# Altium project ADC_System_PCB.PrjPcb (part 1 of 3)
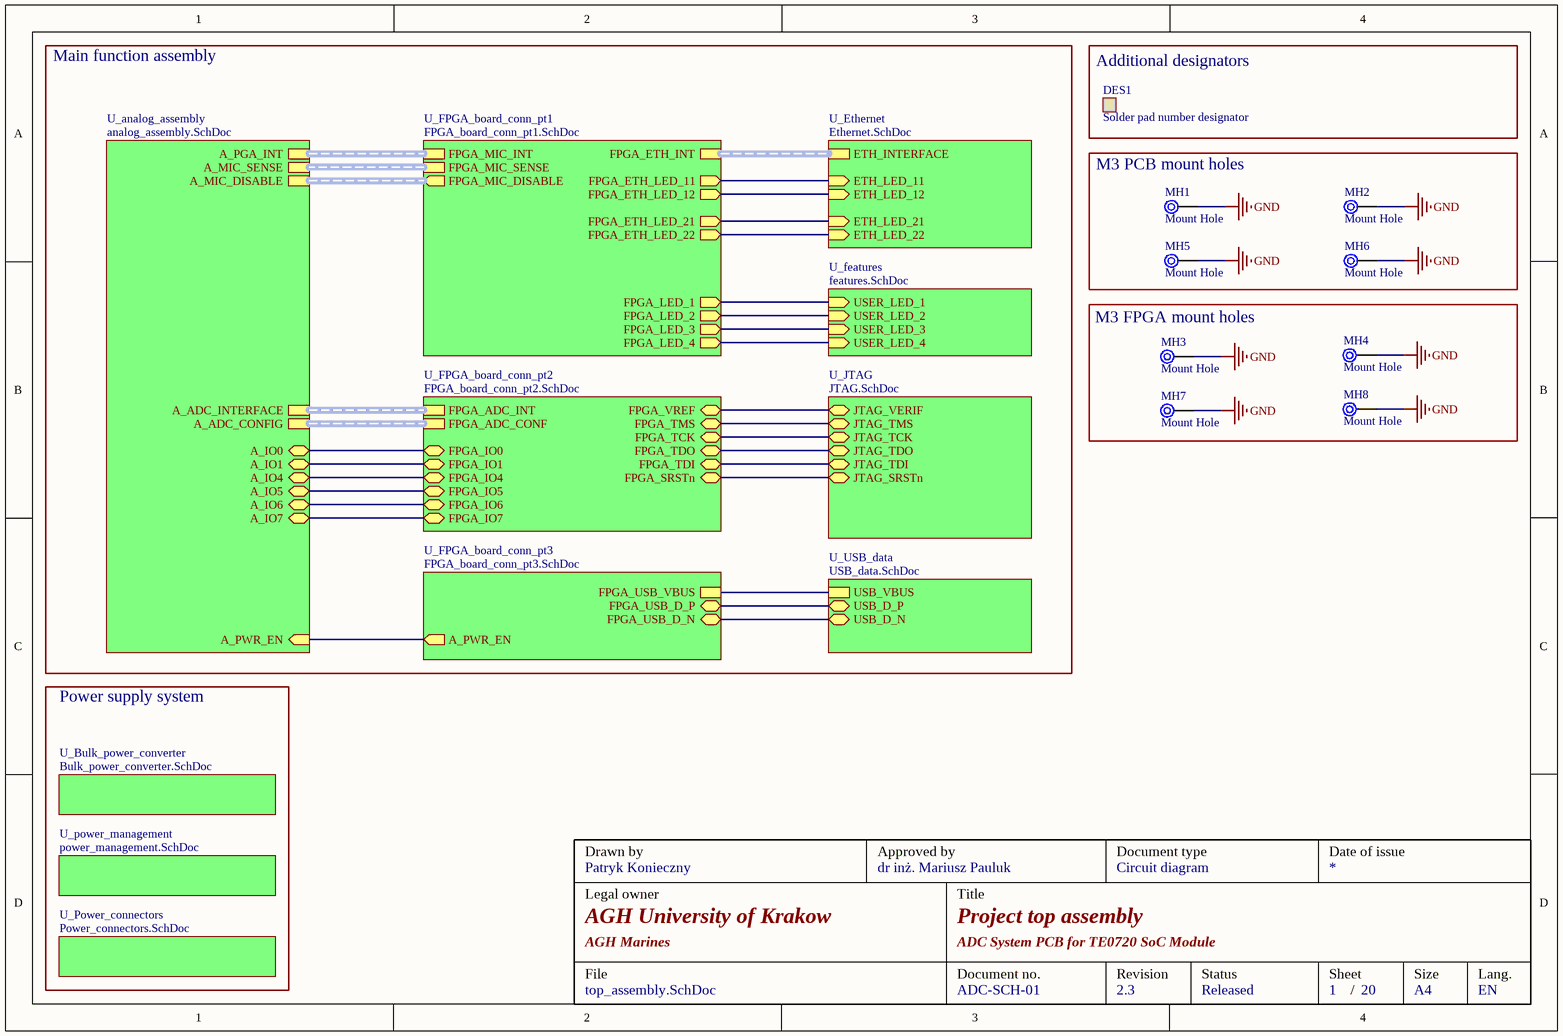
[diagram p0: top_assembly.SchDoc]
ProjectTitle: ADC System PCB for TE0720 SoC Module; ProjectRevision: 2.3; ProjectDrawnBy: Patryk Konieczny; ProjCompany: AGH University of Krakow; ProjApprovedBy: dr inż. Mariusz Pauluk; DocumentStatus: Released
20 sheets, 535 parts. Net scope: hierarchical (ports join the sheet entries above them; power ports are global).
Board file: main_ADC_PCB.PcbDoc
Sheets:
  top_assembly.SchDoc
    U_JTAG = JTAG.SchDoc
    U_USB_data = USB_data.SchDoc
    U_power_management = power_management.SchDoc
    U_Power_connectors = Power_connectors.SchDoc
    U_features = features.SchDoc
    U_Ethernet = Ethernet.SchDoc
    U_analog_assembly = analog_assembly.SchDoc
      U_signal_processing_assembly = signal_processing_assembly.SchDoc
        U_MIC_connection = MIC_connection.SchDoc
        U_MIC_connection = MIC_connection.SchDoc
        U_MIC_connection = MIC_connection.SchDoc
        U_MIC_connection = MIC_connection.SchDoc
        U_double_preamp = double_preamp.SchDoc
        U_double_preamp = double_preamp.SchDoc
        U_double_single_to_diff_conv = double_single_to_diff_conv.SchDoc
        U_double_single_to_diff_conv = double_single_to_diff_conv.SchDoc
        U_band_pass_diff_filter = band_pass_diff_filter.SchDoc
        U_band_pass_diff_filter = band_pass_diff_filter.SchDoc
        U_band_pass_diff_filter = band_pass_diff_filter.SchDoc
        U_band_pass_diff_filter = band_pass_diff_filter.SchDoc
      U_ADC = ADC.SchDoc
      U_switch_isolation = switch_isolation.SchDoc
      U_analog_power = analog_power.SchDoc
    U_Bulk_power_converter = Bulk_power_converter.SchDoc
    U_FPGA_board_conn_pt1 = FPGA_board_conn_pt1.SchDoc
    U_FPGA_board_conn_pt2 = FPGA_board_conn_pt2.SchDoc
    U_FPGA_board_conn_pt3 = FPGA_board_conn_pt3.SchDoc

## Sheet top_assembly.SchDoc: Project top assembly
size A4; ApprovedBy: dr inż. Mariusz Pauluk; CompanyName: AGH University of Krakow; DrawnBy: Patryk Konieczny; DocumentNumber: ADC-SCH-01; Revision: 2.3; SheetNumber: 1; SheetTotal: 20; DocumentStatus: Released

### Parts
DES1  Solder pad number designator  [DES_NUMBER]
MH1  Mount Hole  [MT_M3]
MH2  Mount Hole  [MT_M3]
MH3  Mount Hole  [MT_M3]
MH4  Mount Hole  [MT_M3]
MH5  Mount Hole  [MT_M3]
MH6  Mount Hole  [MT_M3]
MH7  Mount Hole  [MT_M3]
MH8  Mount Hole  [MT_M3]

### Blocks framed on the sheet
Additional designators: DES1
M3 PCB mount holes: MH1 MH2 MH5 MH6
M3 FPGA mount holes: MH3 MH4 MH7 MH8

### Sub-sheets
U_analog_assembly = analog_assembly.SchDoc: A_PWR_EN (in), A_MIC_SENSE (harness mic connected sense), A_MIC_DISABLE (harness mic analog disable), A_PGA_INT (harness PGA  interface), A_ADC_INTERFACE (harness ADC interface), A_ADC_CONFIG (harness ADC config), A_IO0 (bidir), A_IO1 (bidir), A_IO4 (bidir), A_IO5 (bidir), A_IO6 (bidir), A_IO7 (bidir)
U_Bulk_power_converter = Bulk_power_converter.SchDoc: no entries
U_Ethernet = Ethernet.SchDoc: ETH_LED_11 (in), ETH_LED_12 (in), ETH_LED_21 (in), ETH_LED_22 (in), ETH_INTERFACE (harness *)
U_features = features.SchDoc: USER_LED_1 (in), USER_LED_2 (in), USER_LED_3 (in), USER_LED_4 (in)
U_FPGA_board_conn_pt1 = FPGA_board_conn_pt1.SchDoc: FPGA_ETH_INT (harness ETH interface), FPGA_ETH_LED_11 (out), FPGA_ETH_LED_12 (out), FPGA_ETH_LED_21 (out), FPGA_ETH_LED_22 (out), FPGA_LED_1 (out), FPGA_LED_2 (out), FPGA_LED_3 (out), FPGA_LED_4 (out), FPGA_MIC_SENSE (harness mic connected sense), FPGA_MIC_DISABLE (out, harness mic analog disable), FPGA_MIC_INT (harness PGA  interface)
U_FPGA_board_conn_pt2 = FPGA_board_conn_pt2.SchDoc: FPGA_TCK (bidir), FPGA_TDO (bidir), FPGA_TDI (bidir), FPGA_TMS (bidir), FPGA_VREF (bidir), FPGA_SRSTn (bidir), FPGA_ADC_INT (harness ADC interface), FPGA_ADC_CONF (harness ADC config), FPGA_IO0 (bidir), FPGA_IO1 (bidir), FPGA_IO4 (bidir), FPGA_IO5 (bidir), FPGA_IO6 (bidir), FPGA_IO7 (bidir)
U_FPGA_board_conn_pt3 = FPGA_board_conn_pt3.SchDoc: FPGA_USB_VBUS, FPGA_USB_D_P (bidir), FPGA_USB_D_N (bidir), A_PWR_EN (out)
U_JTAG = JTAG.SchDoc: JTAG_VERIF (bidir), JTAG_TMS (bidir), JTAG_TCK (bidir), JTAG_TDO (bidir), JTAG_TDI (bidir), JTAG_SRSTn (bidir)
U_Power_connectors = Power_connectors.SchDoc: no entries
U_power_management = power_management.SchDoc: no entries
U_USB_data = USB_data.SchDoc: USB_VBUS, USB_D_P (bidir), USB_D_N (bidir)

### Nets
GND: MH1.1 MH2.1 MH3.1 MH4.1 MH5.1 MH6.1 MH7.1 MH8.1
IO0_FPGA: sheet U_analog_assembly/A_IO0, sheet U_FPGA_board_conn_pt2/FPGA_IO0
IO1_FPGA: sheet U_analog_assembly/A_IO1, sheet U_FPGA_board_conn_pt2/FPGA_IO1
IO4_FPGA: sheet U_analog_assembly/A_IO4, sheet U_FPGA_board_conn_pt2/FPGA_IO4
IO5_FPGA: sheet U_analog_assembly/A_IO5, sheet U_FPGA_board_conn_pt2/FPGA_IO5
IO6_FPGA: sheet U_analog_assembly/A_IO6, sheet U_FPGA_board_conn_pt2/FPGA_IO6
IO7_FPGA: sheet U_analog_assembly/A_IO7, sheet U_FPGA_board_conn_pt2/FPGA_IO7
JTAG_TCK: sheet U_JTAG/JTAG_TCK, sheet U_FPGA_board_conn_pt2/FPGA_TCK
JTAG_TDI: sheet U_JTAG/JTAG_TDI, sheet U_FPGA_board_conn_pt2/FPGA_TDI
JTAG_TDO: sheet U_JTAG/JTAG_TDO, sheet U_FPGA_board_conn_pt2/FPGA_TDO
JTAG_TMS: sheet U_JTAG/JTAG_TMS, sheet U_FPGA_board_conn_pt2/FPGA_TMS
JTAG_VREF: sheet U_JTAG/JTAG_VERIF, sheet U_FPGA_board_conn_pt2/FPGA_VREF
USB_D_N: sheet U_USB_data/USB_D_N, sheet U_FPGA_board_conn_pt3/FPGA_USB_D_N
USB_D_P: sheet U_USB_data/USB_D_P, sheet U_FPGA_board_conn_pt3/FPGA_USB_D_P
USB_VBUS: sheet U_USB_data/USB_VBUS, sheet U_FPGA_board_conn_pt3/FPGA_USB_VBUS
NetJM1_35: sheet U_features/USER_LED_1, sheet U_FPGA_board_conn_pt1/FPGA_LED_1
NetJM1_37: sheet U_features/USER_LED_2, sheet U_FPGA_board_conn_pt1/FPGA_LED_2
NetJM1_39: sheet U_features/USER_LED_3, sheet U_FPGA_board_conn_pt1/FPGA_LED_3
NetJM1_41: sheet U_features/USER_LED_4, sheet U_FPGA_board_conn_pt1/FPGA_LED_4
NetJM1_56: sheet U_Ethernet/ETH_LED_11, sheet U_FPGA_board_conn_pt1/FPGA_ETH_LED_11
NetJM1_58: sheet U_Ethernet/ETH_LED_12, sheet U_FPGA_board_conn_pt1/FPGA_ETH_LED_12
NetJM1_60: sheet U_Ethernet/ETH_LED_21, sheet U_FPGA_board_conn_pt1/FPGA_ETH_LED_21
NetJM1_62: sheet U_Ethernet/ETH_LED_22, sheet U_FPGA_board_conn_pt1/FPGA_ETH_LED_22
NetJM2_17: sheet U_JTAG/JTAG_SRSTn, sheet U_FPGA_board_conn_pt2/FPGA_SRSTn
NetJM3_26: sheet U_analog_assembly/A_PWR_EN, sheet U_FPGA_board_conn_pt3/A_PWR_EN

### Buses and harness runs
harness sheet U_analog_assembly/A_ADC_CONFIG = sheet U_FPGA_board_conn_pt2/FPGA_ADC_CONF
harness sheet U_analog_assembly/A_ADC_INTERFACE = sheet U_FPGA_board_conn_pt2/FPGA_ADC_INT
harness sheet U_analog_assembly/A_MIC_DISABLE = sheet U_FPGA_board_conn_pt1/FPGA_MIC_DISABLE
harness sheet U_analog_assembly/A_MIC_SENSE = sheet U_FPGA_board_conn_pt1/FPGA_MIC_SENSE
harness sheet U_analog_assembly/A_PGA_INT = sheet U_FPGA_board_conn_pt1/FPGA_MIC_INT
harness sheet U_Ethernet/ETH_INTERFACE = sheet U_FPGA_board_conn_pt1/FPGA_ETH_INT

### Notes on the sheet
- Main function assembly
- Power supply system
- Drawn by
- Approved by
- Document type
- Date of issue
- Legal owner
- Title
- Circuit diagram
- File
- AGH Marines
- Document no.
- Revision
- Status
- Sheet
- Size
- Lang.
- /
- A4
- EN

### Library data of the parts
MH1-MH8 = MH

## Sheet JTAG.SchDoc: TE0720 JTAG connector and reset
size A4; DocumentNumber: ADC-SCH-17; SheetNumber: 17; SheetTotal: 20
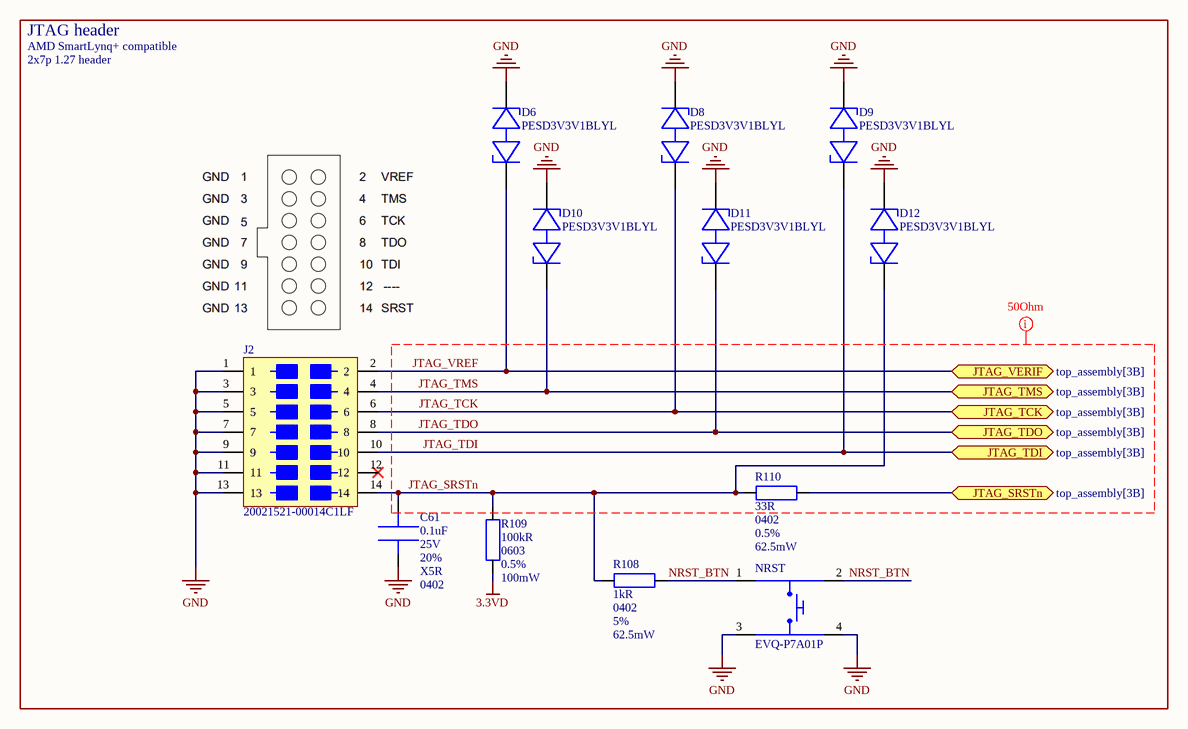
[diagram p1: JTAG.SchDoc]

### Parts
C61  value 0.1uF  Voltage: 25V  Tolerance: 20%  Dielectric: X5R  Package: 0402  [CAPC_0402]  (hidden comment: MSAST105SB5104MFNA01)
D6  PESD3V3V1BLYL  [DIOC_DFN-1006-2]
D8  PESD3V3V1BLYL  [DIOC_DFN-1006-2]
D9  PESD3V3V1BLYL  [DIOC_DFN-1006-2]
D10  PESD3V3V1BLYL  [DIOC_DFN-1006-2]
D11  PESD3V3V1BLYL  [DIOC_DFN-1006-2]
D12  PESD3V3V1BLYL  [DIOC_DFN-1006-2]
J2  20021521-00014C1LF  [CONS_20021521-00014C1LF]
NRST  EVQ-P7A01P  [SWS_EVQP7A]
R108  value 1kR  Package: 0402  Tolerance: 5%  Power: 62.5mW  [RESC_0402]  (hidden comment: RC0402JR-7D1KL)
R109  value 100kR  Package: 0603  Tolerance: 0.5%  Power: 100mW  [RESC_0603]  (hidden comment: AC0603DR-07100KL)
R110  value 33R  Package: 0402  Tolerance: 0.5%  Power: 62.5mW  [RESC_0402]  (hidden comment: RG1005R-330-D-T10)

### Ports
JTAG_SRSTn (bidir, see top_assembly[3B]), JTAG_TCK (bidir, see top_assembly[3B]), JTAG_TDI (bidir, see top_assembly[3B]), JTAG_TDO (bidir, see top_assembly[3B]), JTAG_TMS (bidir, see top_assembly[3B]), JTAG_VERIF (bidir, see top_assembly[3B])

### Nets
3.3VD: R109.2
GND: C61.2 D6.2 D8.2 D9.2 D10.2 D11.2 D12.2 J2.1 J2.3 J2.5 J2.7 J2.9 J2.11 J2.13 NRST.3 NRST.4
JTAG_SRSTn: C61.1 D12.1 J2.14 R108.1 R109.1 R110.2
JTAG_TCK: D8.1 J2.6 ; port JTAG_TCK
JTAG_TDI: D9.1 J2.10 ; port JTAG_TDI
JTAG_TDO: D11.1 J2.8 ; port JTAG_TDO
JTAG_TMS: D10.1 J2.4 ; port JTAG_TMS
JTAG_VREF: D6.1 J2.2 ; port JTAG_VERIF
NRST_BTN: NRST.1 NRST.2 R108.2
NetJM2_17: R110.1 ; port JTAG_SRSTn

Not connected (* = marked no-connect by the designer): J2 12*

### Layout directives
net class 50OhmSingle: JTAG_SRSTn, JTAG_TCK, JTAG_TDI, JTAG_TDO, JTAG_TMS, JTAG_VREF

### Notes on the sheet
- JTAG header
- AMD SmartLynq+ compatible
- 2x7p 1.27 header
- Drawn by
- Approved by
- Document type
- Date of issue
- Legal owner
- Title
- Circuit diagram
- File
- AGH Marines
- Document no.
- Revision
- Status
- Sheet
- Size
- Lang.
- /
- A4
- EN

### Library data of the parts
C61 = MSAST105SB5104MFNA01: Multilayer Ceramic Capacitors MLCC - SMD/SMT 25V 0.1uF X5R 0402 20%; Manufacturer: TAIYO YUDEN; Supplier 1: Mouser; Supplier Part Number 1: 963-MSAST105SB5104MF
D6 D8-D12 = PESD3V3V1BLYL: ESD Protection Diodes / TVS Diodes SOD882 3.3V BID ESD PROTECT; Manufacturer: Nexperia; Capacitance: 11pF; Package: DFN-1006-2; Voltage: 3.3V; Supplier 1: Mouser; Supplier Part Number 1: 771-PESD3V3V1BLYL
J2 = 20021521-00014C1LF: Headers & Wire Housings VERTICAL SMT TYPE HEADER; Manufacturer: Amphenol FCI; Supplier 1: Mouser; Supplier Part Number 1: 649-202152100014C1LF
NRST = EVQ-P7A01P: Tactile Switches 3.5x2.9mm Right Ang Light Touch Switch; Manufacturer: Panasonic; Supplier 1: Mouser; Supplier Part Number 1: 667-EVQP7A01P
R108 = RC0402JR-7D1KL: Thick Film Resistors - SMD General Purpose Chip Resistor 0402, 1kOhms, 5%, 1/16W; Manufacturer: YAGEO; Supplier 1: Mouser; Supplier Part Number 1: 603-RC0402JR-7D1KL
R109 = AC0603DR-07100KL: Thick Film Resistors - SMD 100 kOhms 1/10 W 75 V 0.5 % 0603 100 PPM / C - 55 C / + 155 C AEC-Q200; Manufacturer: YAGEO; Supplier 1: Mouser; Supplier Part Number 1: 603-AC0603DR-07100KL
R110 = RG1005R-330-D-T10: Thin Film Resistors - SMD 1/16W 33 Ohms 0.5% 0402 100ppm; Manufacturer: Susumu; Supplier 1: Mouser; Supplier Part Number 1: 754-RG1005R-330DT10

## Sheet USB_data.SchDoc: USB-C 2.0 connector
size A4; DocumentNumber: ADC-SCH-20; SheetNumber: 20; SheetTotal: 20
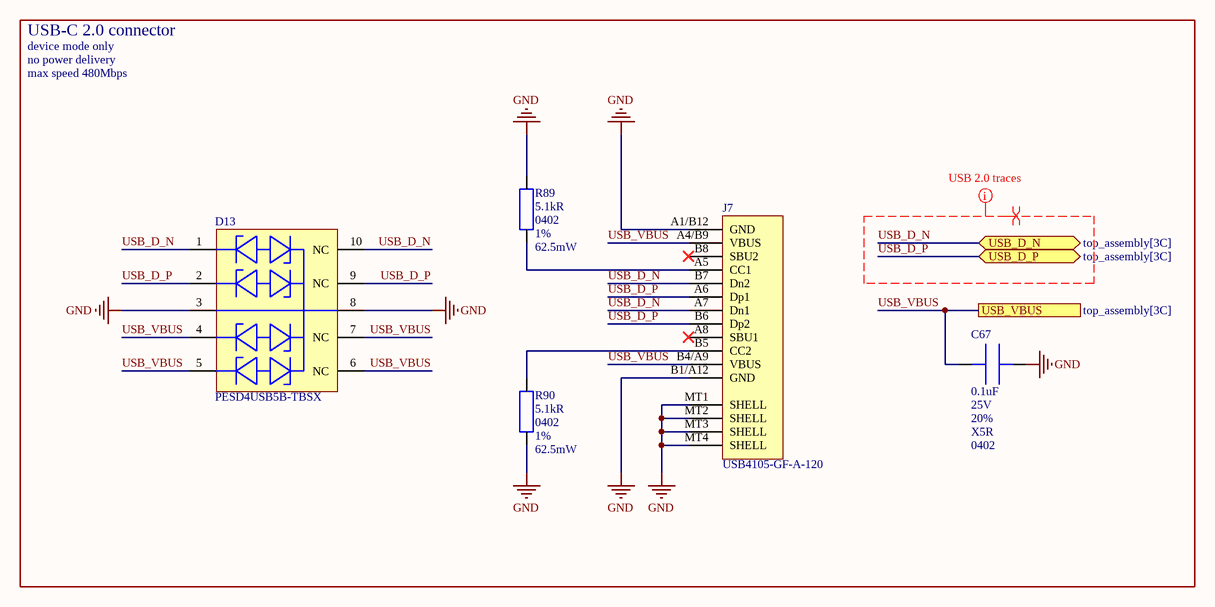
[diagram p2: USB_data.SchDoc]

### Parts
C67  value 0.1uF  Voltage: 25V  Tolerance: 20%  Dielectric: X5R  Package: 0402  [CAPC_0402]  (hidden comment: MSAST105SB5104MFNA01)
D13  PESD4USB5B-TBSX  [DIOC_DFN-2510A-10]
J7  USB4105-GF-A-120  [CONT_USB4105-GF-A-120]
R89  value 5.1kR  Package: 0402  Tolerance: 1%  Power: 62.5mW  [RESC_0402]  (hidden comment: AC0402FR-075K1L)
R90  value 5.1kR  Package: 0402  Tolerance: 1%  Power: 62.5mW  [RESC_0402]  (hidden comment: AC0402FR-075K1L)

### Ports
USB_D_N (bidir, see top_assembly[3C]), USB_D_P (bidir, see top_assembly[3C]), USB_VBUS (see top_assembly[3C])

### Nets
GND: C67.1 D13.3 D13.8 J7.A1/B12(GND) J7.B1/A12(GND) J7.MT1(SHELL) J7.MT2(SHELL) J7.MT3(SHELL) J7.MT4(SHELL) R89.2 R90.2
USB_D_N: D13.1 D13.10(NC) J7.A7(Dn1) J7.B7(Dn2) ; port USB_D_N
USB_D_P: D13.2 D13.9(NC) J7.A6(Dp1) J7.B6(Dp2) ; port USB_D_P
USB_VBUS: C67.2 D13.4 D13.5 D13.6(NC) D13.7(NC) J7.A4/B9(VBUS) J7.B4/A9(VBUS) ; port USB_VBUS
NetJ7_A5: J7.A5(CC1) R89.1
NetJ7_B5: J7.B5(CC2) R90.1

Not connected (* = marked no-connect by the designer): J7 A8(SBU1)* B8(SBU2)*

### Layout directives
mark named USB 2.0 traces: USB_D_N, USB_D_P
differential pair; differential pair class 90OhmDiff: USB_D_N, USB_D_P

### Notes on the sheet
- USB-C 2.0 connector
- device mode only
- no power delivery
- max speed 480Mbps
- Drawn by
- Approved by
- Document type
- Date of issue
- Legal owner
- Title
- Circuit diagram
- File
- AGH Marines
- Document no.
- Revision
- Status
- Sheet
- Size
- Lang.
- /
- A4
- EN

### Library data of the parts
C67 = MSAST105SB5104MFNA01: as C61 on sheet JTAG; Supplier 1: Mouser; Supplier Part Number 1: 963-MSAST105SB5104MF
D13 = PESD4USB5B-TBSX: ESD Protection Diodes / TVS Diodes ESD 5V BI; Manufacturer: Nexperia; Capacitance: 0.3pF; Package: DFN-2510D-10; Voltage: 5V; Supplier 1: Mouser; Supplier Part Number 1: 771-PESD4USB5B-TBSX
J7 = USB4105-GF-A-120: USB Connectors USB Type C, 2.0 SMT PCB Top Mnt 1.20mm; Manufacturer: GCT; Supplier 1: Mouser; Supplier Part Number 1: 640-USB4105-GF-A-120
R89 R90 = AC0402FR-075K1L: Thick Film Resistors - SMD 5.1 kOhms 1/16 W 50 V 1 % 0402 100 PPM / C - 55 C / + 155 C AEC-Q200; Manufacturer: YAGEO; Supplier 1: Mouser; Supplier Part Number 1: 603-AC0402FR-075K1L

## Sheet power_management.SchDoc: Low-noise powr supply for digital systems
size A4; DocumentNumber: ADC-SCH-19; SheetNumber: 19; SheetTotal: 20
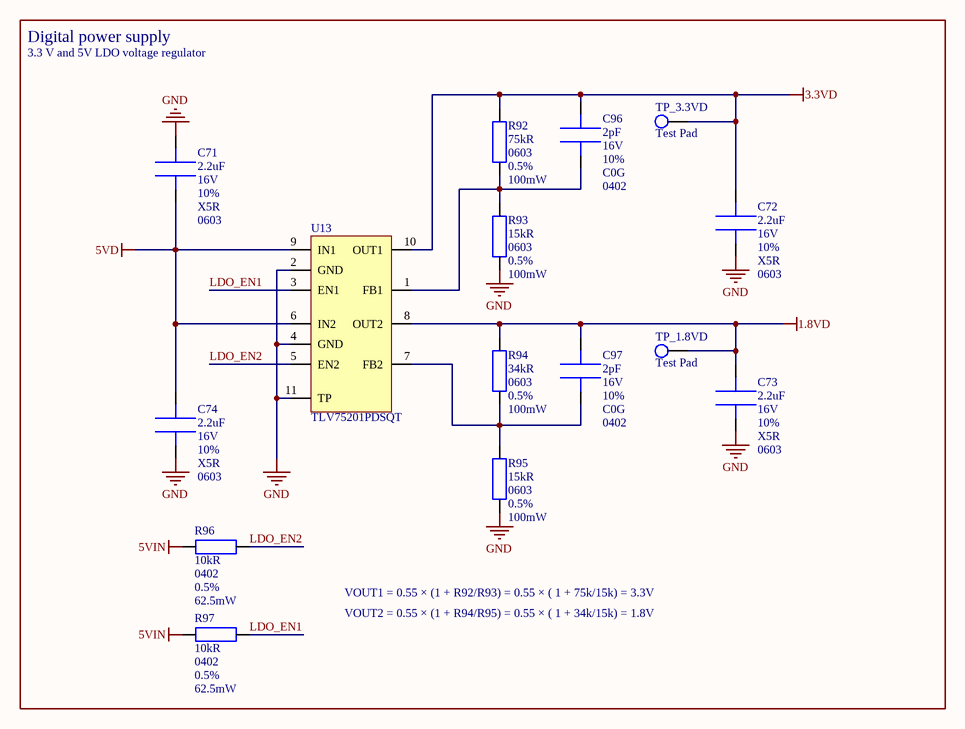
[diagram p3: power_management.SchDoc]

### Parts
C71  value 2.2uF  Voltage: 16V  Tolerance: 10%  Dielectric: X5R  Package: 0603  [CAPC_0603]  (hidden comment: C0603C225K4PAC)
C72  value 2.2uF  Voltage: 16V  Tolerance: 10%  Dielectric: X5R  Package: 0603  [CAPC_0603]  (hidden comment: C0603C225K4PAC)
C73  value 2.2uF  Voltage: 16V  Tolerance: 10%  Dielectric: X5R  Package: 0603  [CAPC_0603]  (hidden comment: C0603C225K4PAC)
C74  value 2.2uF  Voltage: 16V  Tolerance: 10%  Dielectric: X5R  Package: 0603  [CAPC_0603]  (hidden comment: C0603C225K4PAC)
C96  value 2pF  Voltage: 16V  Tolerance: 10%  Dielectric: C0G  Package: 0402  [CAPC_0402]  (hidden comment: GJM1555C1H2R0CB01J)
C97  value 2pF  Voltage: 16V  Tolerance: 10%  Dielectric: C0G  Package: 0402  [CAPC_0402]  (hidden comment: GJM1555C1H2R0CB01J)
R92  value 75kR  Package: 0603  Tolerance: 0.5%  Power: 100mW  [RESC_0603]  (hidden comment: RT0603DRD0775KL)
R93  value 15kR  Package: 0603  Tolerance: 0.5%  Power: 100mW  [RESC_0603]  (hidden comment: RT0603DRD0715KL)
R94  value 34kR  Package: 0603  Tolerance: 0.5%  Power: 100mW  [RESC_0603]  (hidden comment: RT0603DRE0734KL)
R95  value 15kR  Package: 0603  Tolerance: 0.5%  Power: 100mW  [RESC_0603]  (hidden comment: RT0603DRD0715KL)
R96  value 10kR  Package: 0402  Tolerance: 0.5%  Power: 62.5mW  [RESC_0402]  (hidden comment: AC0402DR-0710KL)
R97  value 10kR  Package: 0402  Tolerance: 0.5%  Power: 62.5mW  [RESC_0402]  (hidden comment: AC0402DR-0710KL)
TP_1.8VD  Test Pad  [TP_1.4mm]
TP_3.3VD  Test Pad  [TP_1.4mm]
U13  TLV75201PDSQT  [IC_WSON-10]

### Nets
1.8VD: C73.1 C97.1 R94.1 TP_1.8VD.1 U13.8(OUT2)
3.3VD: C72.1 C96.1 R92.2 TP_3.3VD.1 U13.10(OUT1)
5VD: C71.2 C74.1 U13.6(IN2) U13.9(IN1)
5VIN: R96.2 R97.2
GND: C71.1 C72.2 C73.2 C74.2 R93.1 R95.1 U13.2(GND) U13.4(GND) U13.11(TP)
LDO_EN1: R97.1 U13.3(EN1)
LDO_EN2: R96.1 U13.5(EN2)
NetC96_2: C96.2 R92.1 R93.2 U13.1(FB1)
NetC97_2: C97.2 R94.2 R95.2 U13.7(FB2)

### Notes on the sheet
- Digital power supply
- 3.3 V and 5V LDO voltage regulator
- VOUT1 = 0.55 × (1 + R92/R93) = 0.55 × ( 1 + 75k/15k) = 3.3V
- VOUT2 = 0.55 × (1 + R94/R95) = 0.55 × ( 1 + 34k/15k) = 1.8V
- Drawn by
- Approved by
- Document type
- Date of issue
- Legal owner
- Title
- Circuit diagram
- File
- AGH Marines
- Document no.
- Revision
- Status
- Sheet
- Size
- Lang.
- /
- A4
- EN

### Library data of the parts
C71-C74 = C0603C225K4PAC: Multilayer Ceramic Capacitors MLCC - SMD/SMT 16V 2.2uF X5R 0603 10%; Manufacturer: KEMET; Supplier 1: Mouser; Supplier Part Number 1: 80-C0603C225K4PAC
C96 C97 = GJM1555C1H2R0CB01J: Multilayer Ceramic Capacitors MLCC - SMD/SMT 2 pF 50 VDC 0.25 pF 0402 C0G (NP0); Manufacturer: Murata Electronics; Supplier 1: Mouser; Supplier Part Number 1: 81-GJM1555C1H2R0CB1J
R92 = RT0603DRD0775KL: Thin Film Resistors 1/10W 75K ohm .5% 25ppm; Manufacturer: YAGEO; Supplier 1: Mouser; Supplier Part Number 1: 603-RT0603DRD0775KL
R93 R95 = RT0603DRD0715KL: Thin Film Resistors 15K Ohm 0.5% 1/10W 75 Volts 25ppm; Manufacturer: YAGEO; Supplier 1: Mouser; Supplier Part Number 1: 603-RT0603DRD0715KL
R94 = RT0603DRE0734KL: Thin Film Resistors 1/10W 34K ohm .5% 50ppm; Manufacturer: YAGEO; Supplier 1: Mouser; Supplier Part Number 1: 603-RT0603DRE0734KL
R96 R97 = AC0402DR-0710KL: Thick Film Resistors - SMD 10 kOhms 1/16 W 50 V 1% 0402 100 PPM / C - 55 C + 155 C AEC-Q200; Manufacturer: YAGEO; Supplier 1: Mouser; Supplier Part Number 1: 603-AC0402DR-0710KL
U13 = TLV75201PDSQT: LDO Voltage Regulators 1-A low-IQ high-PS RR adjustable dual A 595-TLV75201PDSQR; Manufacturer: Texas Instruments; Package: WSON-10; Supplier 1: Mouser; Supplier Part Number 1: 595-TLV75201PDSQT

## Sheet Power_connectors.SchDoc: Power connectors and power LEDs
size A4; DocumentNumber: ADC-SCH-18; SheetNumber: 18; SheetTotal: 20
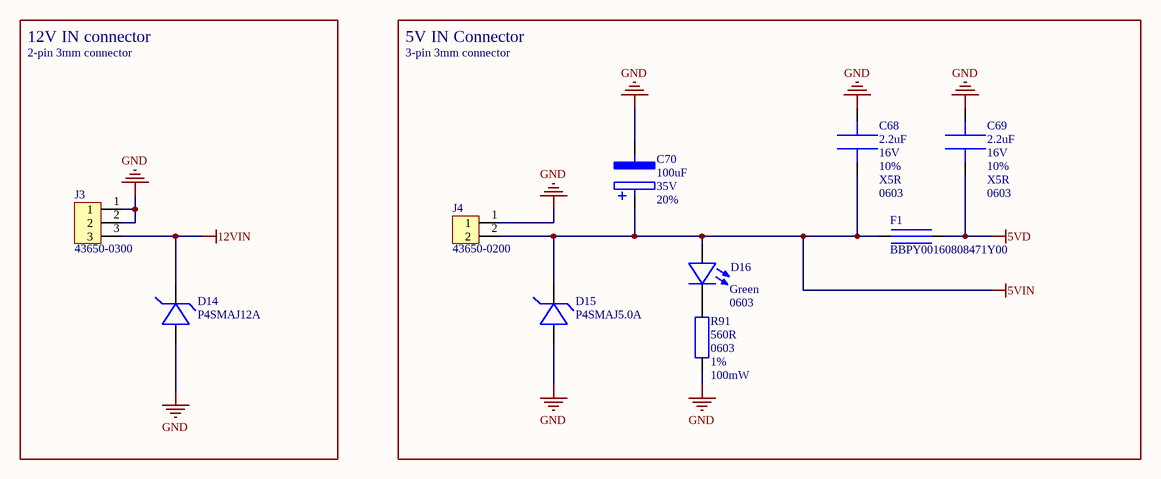
[diagram p4: Power_connectors.SchDoc]

### Parts
C68  value 2.2uF  Voltage: 16V  Tolerance: 10%  Dielectric: X5R  Package: 0603  [CAPC_0603]  (hidden comment: C0603C225K4PAC)
C69  value 2.2uF  Voltage: 16V  Tolerance: 10%  Dielectric: X5R  Package: 0603  [CAPC_0603]  (hidden comment: C0603C225K4PAC)
C70  value 100uF  Voltage: 35V  Tolerance: 20%  [CAPE_6.3R_7.7H]  (hidden comment: EDK107M035S9HAA)
D14  P4SMAJ12A  [DIOC_DO-214AC]
D15  P4SMAJ5.0A  [DIOC_DO-214AC]
D16  package: 0603  color: Green  [DIOC_0603_LED]  (hidden comment: KG EELP41.22-PHRH-35-A8J8-20-R18)
F1  BBPY00160808471Y00  [FERC_0603]
J3  43650-0300  [CONT_43650-0300]
J4  43650-0200  [CONT_43650-0200]
R91  value 560R  Package: 0603  Tolerance: 1%  Power: 100mW  [RESC_0603]  (hidden comment: RC0603FR-07560RL)

### Blocks framed on the sheet
12V IN connector: D14 J3
5V IN Connector: C68-C70 D15 D16 F1 J4 R91

### Nets
5VD: C69.2 F1.1
5VIN: C68.2 C70.1 D15.2 D16.1 F1.2 J4.2
12VIN: D14.2 J3.3
GND: C68.1 C69.1 C70.2 D14.1 D15.1 J3.1 J3.2 J4.1 R91.2
NetD16_2: D16.2 R91.1

### Notes on the sheet
- 2-pin 3mm connector
- 3-pin 3mm connector
- Drawn by
- Approved by
- Document type
- Date of issue
- Legal owner
- Title
- Circuit diagram
- File
- AGH Marines
- Document no.
- Revision
- Status
- Sheet
- Size
- Lang.
- /
- A4
- EN

### Library data of the parts
C68 C69 = C0603C225K4PAC: as C71 on sheet power_management; Supplier 1: Mouser; Supplier Part Number 1: 80-C0603C225K4PAC
C70 = EDK107M035S9HAA: Aluminum Electrolytic Capacitors - SMD 35V 100uF AEC-Q200 20% 85C/2K Hours; Manufacturer: KEMET; Package: 6.3x7.7; Supplier 1: Mouser; Supplier Part Number 1: 80-EDK107M035S9HAA
D14 = P4SMAJ12A: ESD Protection Diodes / TVS Diodes TVS, SMA, 150C, 400W, Unidir; Manufacturer: Diotec Semiconductor; Breakdown voltage: 12V; Package: DO-214AC-2; Supplier 1: Mouser; Supplier Part Number 1: 637-P4SMAJ12A
D15 = P4SMAJ5.0A: ESD Protection Diodes / TVS Diodes TVS, SMA, 150C, 400W, Unidir; Manufacturer: Diotec Semiconductor; Breakdown voltage: 5V; Package: DO-214AC-2; Supplier 1: Mouser; Supplier Part Number 1: 637-P4SMAJ5.0A
D16 = KG EELP41.22-PHRH-35-A8J8-20-R18: Single Color LEDs; Supplier 1: Mouser; Supplier Part Number 1: 720-P4122PHRH35A8J82
F1 = BBPY00160808471Y00: Ferrite Beads 470Ohms RDC=0.15Ohms 1500mA; Manufacturer: Pulse Electronics; Package: 0603; Supplier 1: Mouser; Supplier Part Number 1: 603-BBPY160808471Y00
J3 = 43650-0300: Headers & Wire Housings R/A HEADER 3 POS TIN SINGLE ROW; Manufacturer: Molex; Pin number: 3; Supplier 1: Mouser; Supplier Part Number 1: 538-43650-0300
J4 = 43650-0200: Nr Mouser: / 538-43650-0200 / Nr prod.: / 43650-0200 / Produc.: / Molex / Nr klienta: / Nr klienta / Opis: / Headers & Wire Housings R/A HEADER 2 POS TIN SINGLE ROW; Pin number: 2; Manufacturer: Molex; Supplier 1: Mouser; Supplier Part Number 1: 538-43650-0200
R91 = RC0603FR-07560RL: Thick Film Resistors - SMD General Purpose Chip Resistor 0603, 560Ohms, 1%, 1/10W; Manufacturer: YAGEO; Supplier 1: Mouser; Supplier Part Number 1: 603-RC0603FR-07560RL

## Sheet features.SchDoc: Features: User LEDs
size A4; DocumentNumber: ADC-SCH-13; SheetNumber: 13; SheetTotal: 20
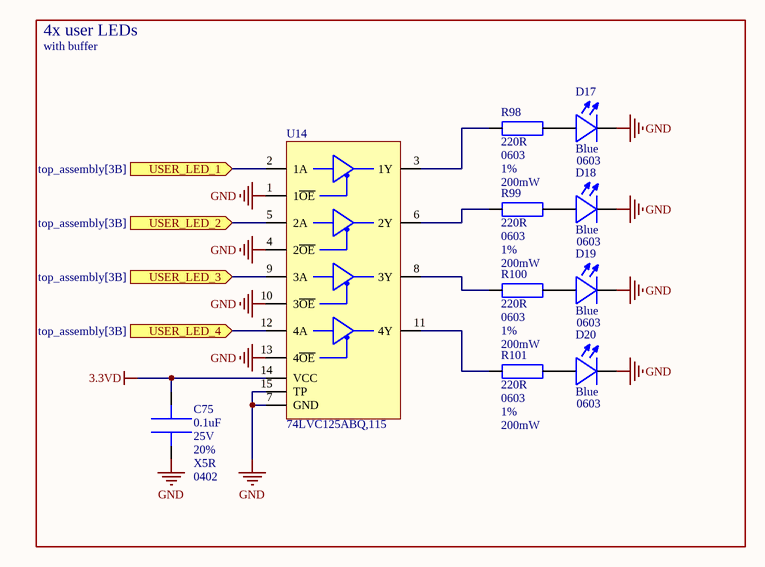
[diagram p5: features.SchDoc]

### Parts
C75  value 0.1uF  Voltage: 25V  Tolerance: 20%  Dielectric: X5R  Package: 0402  [CAPC_0402]  (hidden comment: MSAST105SB5104MFNA01)
D17  package: 0603  color: Blue  [DIOC_0603_LED]  (hidden comment: KB EELP41.12-P1R2-36-3X4X-5-R18)
D18  package: 0603  color: Blue  [DIOC_0603_LED]  (hidden comment: KB EELP41.12-P1R2-36-3X4X-5-R18)
D19  package: 0603  color: Blue  [DIOC_0603_LED]  (hidden comment: KB EELP41.12-P1R2-36-3X4X-5-R18)
D20  package: 0603  color: Blue  [DIOC_0603_LED]  (hidden comment: KB EELP41.12-P1R2-36-3X4X-5-R18)
R98  value 220R  Package: 0603  Tolerance: 1%  Power: 200mW  [RESC_0603]  (hidden comment: AC0603FR-7W220RL)
R99  value 220R  Package: 0603  Tolerance: 1%  Power: 200mW  [RESC_0603]  (hidden comment: AC0603FR-7W220RL)
R100  value 220R  Package: 0603  Tolerance: 1%  Power: 200mW  [RESC_0603]  (hidden comment: AC0603FR-7W220RL)
R101  value 220R  Package: 0603  Tolerance: 1%  Power: 200mW  [RESC_0603]  (hidden comment: AC0603FR-7W220RL)
U14  74LVC125ABQ,115  [IC_DHVQFN-14]

### Ports
USER_LED_1 (in, see top_assembly[3B]), USER_LED_2 (in, see top_assembly[3B]), USER_LED_3 (in, see top_assembly[3B]), USER_LED_4 (in, see top_assembly[3B])

### Nets
3.3VD: C75.1 U14.14(VCC)
GND: C75.2 D17.2 D18.2 D19.2 D20.2 U14.1(1~{OE}) U14.4(2~{OE}) U14.7(GND) U14.10(3~{OE}) U14.13(4~{OE}) U14.15(TP)
NetD17_1: D17.1 R98.1
NetD18_1: D18.1 R99.1
NetD19_1: D19.1 R100.1
NetD20_1: D20.1 R101.1
NetJM1_35: U14.2(1A) ; port USER_LED_1
NetJM1_37: U14.5(2A) ; port USER_LED_2
NetJM1_39: U14.9(3A) ; port USER_LED_3
NetJM1_41: U14.12(4A) ; port USER_LED_4
NetR98_2: R98.2 U14.3(1Y)
NetR99_2: R99.2 U14.6(2Y)
NetR100_2: R100.2 U14.8(3Y)
NetR101_2: R101.2 U14.11(4Y)

### Notes on the sheet
- 4x user LEDs
- with buffer
- Drawn by
- Approved by
- Document type
- Date of issue
- Legal owner
- Title
- Circuit diagram
- File
- AGH Marines
- Document no.
- Revision
- Status
- Sheet
- Size
- Lang.
- /
- A4
- EN

### Library data of the parts
C75 = MSAST105SB5104MFNA01: as C61 on sheet JTAG; Supplier 1: Mouser; Supplier Part Number 1: 963-MSAST105SB5104MF
D17-D20 = KB EELP41.12-P1R2-36-3X4X-5-R18: Single Color LEDs; Supplier 1: Mouser; Supplier Part Number 1: 720-P4112P1R2363X4X5
R98-R101 = AC0603FR-7W220RL: Thick Film Resistors - SMD 220 Ohms 1/5 W 75 V 1% 0603 100 PPM / C - 55 C / + 155 C AEC-Q200; Manufacturer: YAGEO; Supplier 1: Mouser; Supplier Part Number 1: 603-AC0603FR-7W220RL
U14 = 74LVC125ABQ,115: Buffers & Line Drivers SOT762-1 BUFFERS & LINE DVRS; Manufacturer: Nexperia; Package: DHVQFN-14; Supplier 1: Mouser; Supplier Part Number 1: 771-LVC125ABQ115

## Sheet Ethernet.SchDoc: Ethernet connector and status LEDs
size A4; DocumentNumber: ADC-SCH-12; SheetNumber: 12; SheetTotal: 20
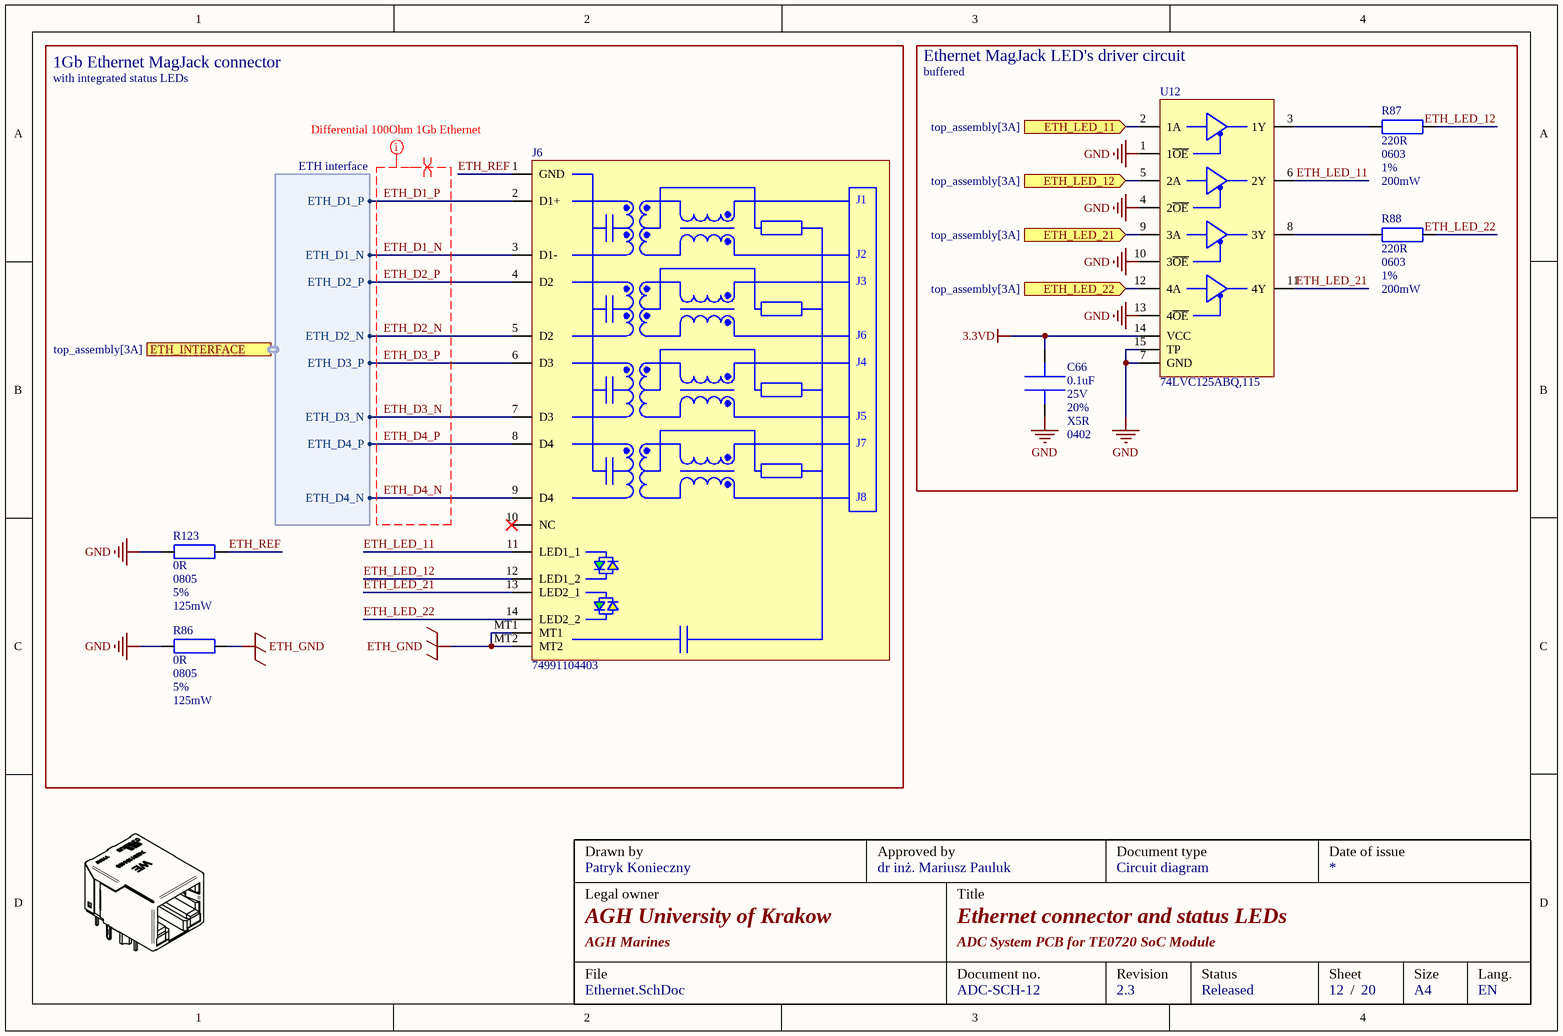
[diagram p6: Ethernet.SchDoc]

### Parts
C66  value 0.1uF  Voltage: 25V  Tolerance: 20%  Dielectric: X5R  Package: 0402  [CAPC_0402]  (hidden comment: MSAST105SB5104MFNA01)
J6  74991104403  [CONT_74991104403]
R86  value 0R  Package: 0805  Tolerance: 5%  Power: 125mW  [RESC_0805]  (hidden comment: RC0805JR-070RP)
R87  value 220R  Package: 0603  Tolerance: 1%  Power: 200mW  [RESC_0603]  (hidden comment: AC0603FR-7W220RL)
R88  value 220R  Package: 0603  Tolerance: 1%  Power: 200mW  [RESC_0603]  (hidden comment: AC0603FR-7W220RL)
R123  value 0R  Package: 0805  Tolerance: 5%  Power: 125mW  [RESC_0805]  (hidden comment: RC0805JR-070RP)
U12  74LVC125ABQ,115  [IC_DHVQFN-14]

### Blocks framed on the sheet
1Gb Ethernet MagJack connector: J6 R86 R123

### Ports
ETH_INTERFACE (harness ETH interface, see top_assembly[3A]), ETH_LED_11 (in, see top_assembly[3A]), ETH_LED_12 (in, see top_assembly[3A]), ETH_LED_21 (in, see top_assembly[3A]), ETH_LED_22 (in, see top_assembly[3A])

### Harnesses
ETH interface: ETH_D1_P, ETH_D1_N, ETH_D2_P, ETH_D2_N, ETH_D3_P, ETH_D3_N, ETH_D4_P, ETH_D4_N

### Nets
3.3VD: C66.1 U12.14(VCC)
ETH_GND: J6.MT1 J6.MT2 R86.1
GND: C66.2 R86.2 R123.2 U12.1(1~{OE}) U12.4(2~{OE}) U12.7(GND) U12.10(3~{OE}) U12.13(4~{OE}) U12.15(TP)
ETH_D1_N: J6.3(D1-) ; port ETH_INTERFACE.ETH_D1_N
ETH_D1_P: J6.2(D1+) ; port ETH_INTERFACE.ETH_D1_P
ETH_D2_N: J6.5(D2) ; port ETH_INTERFACE.ETH_D2_N
ETH_D2_P: J6.4(D2) ; port ETH_INTERFACE.ETH_D2_P
ETH_D3_N: J6.7(D3) ; port ETH_INTERFACE.ETH_D3_N
ETH_D3_P: J6.6(D3) ; port ETH_INTERFACE.ETH_D3_P
ETH_D4_N: J6.9(D4) ; port ETH_INTERFACE.ETH_D4_N
ETH_D4_P: J6.8(D4) ; port ETH_INTERFACE.ETH_D4_P
ETH_LED_11: J6.11(LED1_1) U12.6(2Y)
ETH_LED_12: J6.12(LED1_2) R87.1
ETH_LED_21: J6.13(LED2_1) U12.11(4Y)
ETH_LED_22: J6.14(LED2_2) R88.1
ETH_REF: J6.1(GND) R123.1
NetJM1_56: U12.2(1A) ; port ETH_LED_11
NetJM1_58: U12.5(2A) ; port ETH_LED_12
NetJM1_60: U12.9(3A) ; port ETH_LED_21
NetJM1_62: U12.12(4A) ; port ETH_LED_22
NetR87_2: R87.2 U12.3(1Y)
NetR88_2: R88.2 U12.8(3Y)

Not connected (* = marked no-connect by the designer): J6 10(NC)*

### Layout directives
differential pair; differential pair class 100OhmDiff: ETH_D1_N, ETH_D1_P, ETH_D2_N, ETH_D2_P, ETH_D3_N, ETH_D3_P, ETH_D4_N, ETH_D4_P
mark named Differential 100Ohm 1Gb Ethernet: ETH_D1_N, ETH_D1_P, ETH_D2_N, ETH_D2_P, ETH_D3_N, ETH_D3_P, ETH_D4_N, ETH_D4_P

### Notes on the sheet
- with integrated status LEDs
- Ethernet MagJack LED's driver circuit
- buffered
- Drawn by
- Approved by
- Document type
- Date of issue
- Legal owner
- Title
- Circuit diagram
- File
- AGH Marines
- Document no.
- Revision
- Status
- Sheet
- Size
- Lang.
- /
- A4
- EN
- (in symbol 74991104403) J1; J2; J3; J4; J5; J7; J8

### Library data of the parts
C66 = MSAST105SB5104MFNA01: as C61 on sheet JTAG; Supplier 1: Mouser; Supplier Part Number 1: 963-MSAST105SB5104MF
J6 = 74991104403: Modular Connectors / Ethernet Connectors WE-RJ45LAN 10/100/1000BASE-T THT 1x1 LED L green/yellow LED R green/yellow; Manufacturer: Wurth Elektronik; Supplier 1: Mouser; Supplier Part Number 1: 710-74991104403
R86 R123 = RC0805JR-070RP: Thick Film Resistors - SMD General Purpose Chip Resistor 0805, 0Ohms, 5%, 1/8W; Manufacturer: YAGEO; Supplier 1: Mouser; Supplier Part Number 1: 603-RC0805JR-070RP
R87 R88 = AC0603FR-7W220RL: as R98 on sheet features; Supplier 1: Mouser; Supplier Part Number 1: 603-AC0603FR-7W220RL
U12 = 74LVC125ABQ,115: as U14 on sheet features; Package: DHVQFN-14; Supplier 1: Mouser; Supplier Part Number 1: 771-LVC125ABQ115

## Sheet analog_assembly.SchDoc: Analog system assembly
size A4; DocumentNumber: ADC-SCH-02; SheetNumber: 2; SheetTotal: 20
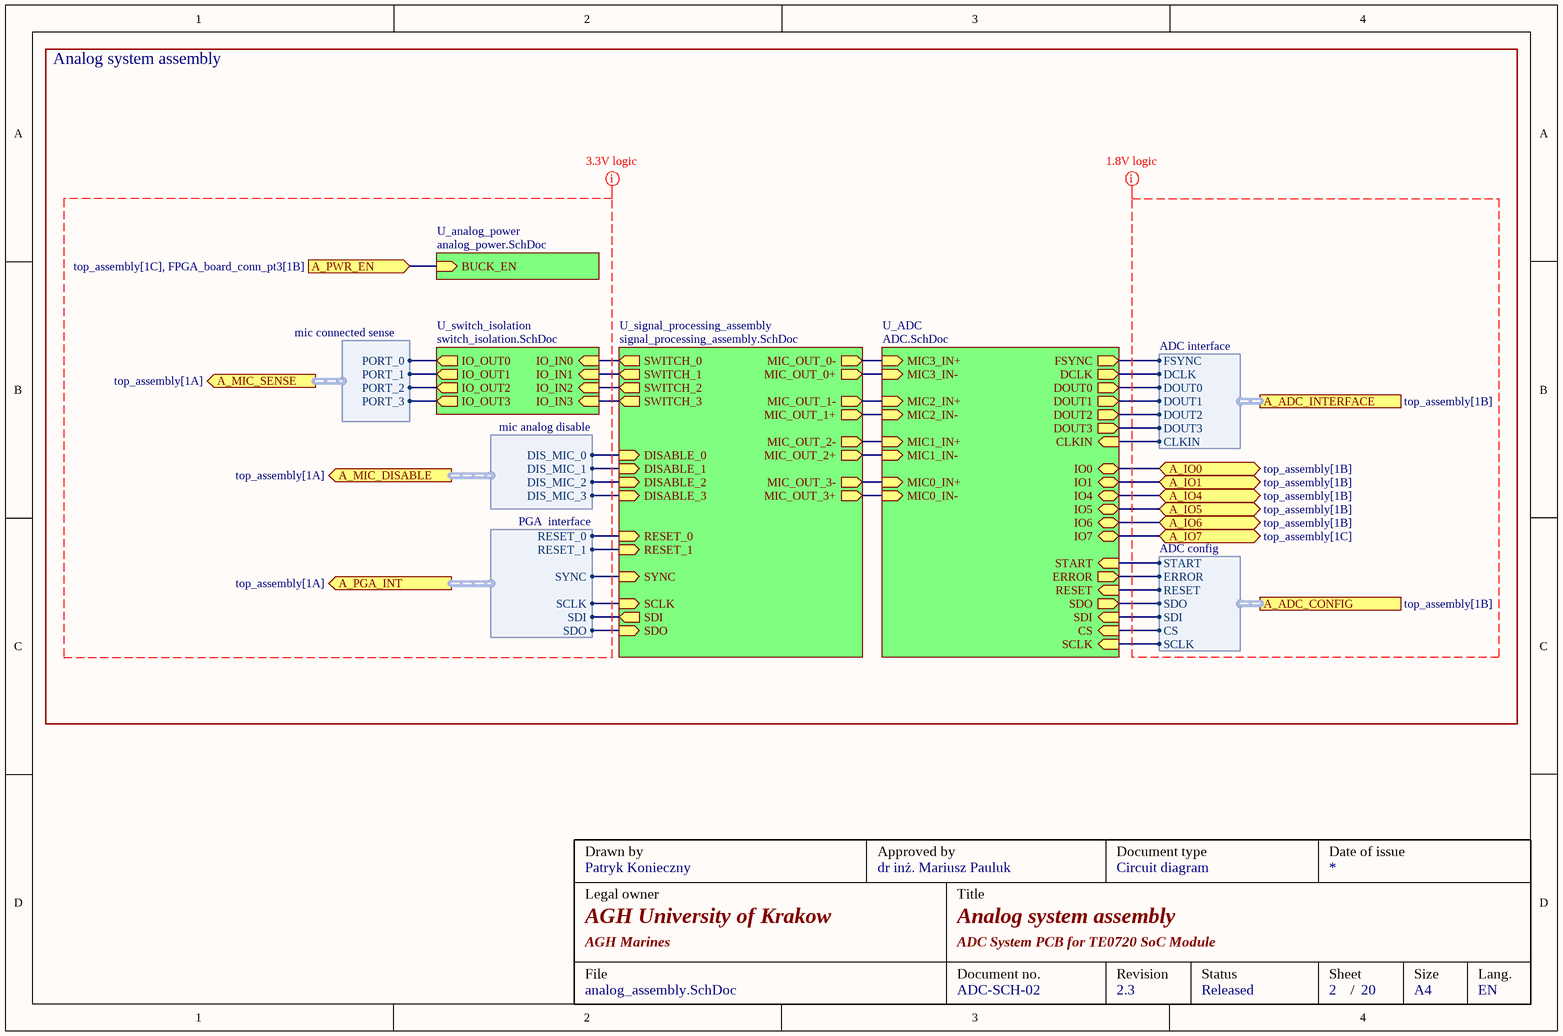
[diagram p7: analog_assembly.SchDoc]

### Sub-sheets
U_ADC = ADC.SchDoc: MIC0_IN+ (in), MIC0_IN- (in), MIC1_IN+ (in), MIC1_IN- (in), MIC2_IN+ (in), MIC2_IN- (in), MIC3_IN+ (in), MIC3_IN- (in), IO6 (bidir), IO7 (bidir), IO5 (bidir), IO1 (bidir), IO4 (bidir), CLKIN (in), FSYNC (out), DCLK (out), DOUT0 (out), DOUT2 (out), DOUT1 (out), DOUT3 (out), ERROR (out), START (in), RESET (in), SDI (in), SDO (out), CS (in), SCLK (in), IO0 (bidir)
U_analog_power = analog_power.SchDoc: BUCK_EN (in)
U_signal_processing_assembly = signal_processing_assembly.SchDoc: MIC_OUT_0- (out), MIC_OUT_0+ (out), MIC_OUT_1- (out), MIC_OUT_1+ (out), MIC_OUT_2- (out), MIC_OUT_2+ (out), MIC_OUT_3- (out), MIC_OUT_3+ (out), DISABLE_0 (in), DISABLE_1 (in), DISABLE_2 (in), DISABLE_3 (in), RESET_0 (in), RESET_1 (in), SYNC (in), SWITCH_0 (out), SWITCH_1 (out), SWITCH_2 (out), SWITCH_3 (out), SCLK (in), SDI (out), SDO (in)
U_switch_isolation = switch_isolation.SchDoc: IO_IN0 (in), IO_IN1 (in), IO_IN2 (in), IO_IN3 (in), IO_OUT0 (out), IO_OUT1 (out), IO_OUT2 (out), IO_OUT3 (out)

### Ports
A_ADC_CONFIG (harness ADC config, see top_assembly[1B]), A_ADC_INTERFACE (harness ADC interface, see top_assembly[1B]), A_IO0 (bidir, see top_assembly[1B]), A_IO1 (bidir, see top_assembly[1B]), A_IO4 (bidir, see top_assembly[1B]), A_IO5 (bidir, see top_assembly[1B]), A_IO6 (bidir, see top_assembly[1B]), A_IO7 (bidir, see top_assembly[1C]), A_MIC_DISABLE (out, harness mic analog disable, see top_assembly[1A]), A_MIC_SENSE (out, harness mic connected sense, see top_assembly[1A]), A_PGA_INT (out, harness PGA  interface, see top_assembly[1A]), A_PWR_EN (in, see top_assembly[1C], FPGA_board_conn_pt3[1B])

### Harnesses
mic connected sense: PORT_0, PORT_1, PORT_2, PORT_3
mic analog disable: DIS_MIC_0, DIS_MIC_1, DIS_MIC_2, DIS_MIC_3
PGA  interface: RESET_0, RESET_1, SYNC, SCLK, SDI, SDO
ADC interface: FSYNC, DCLK, DOUT0, DOUT1, DOUT2, DOUT3, CLKIN
ADC config: START, ERROR, RESET, SDO, SDI, CS, SCLK

### Nets
CLKIN_FPGA: sheet U_ADC/CLKIN, port A_ADC_INTERFACE.CLKIN
CS_FPGA: sheet U_ADC/CS, port A_ADC_CONFIG.CS
DCLK_FPGA: sheet U_ADC/DCLK, port A_ADC_INTERFACE.DCLK
DOUT0_FPGA: sheet U_ADC/DOUT0, port A_ADC_INTERFACE.DOUT0
DOUT1_FPGA: sheet U_ADC/DOUT1, port A_ADC_INTERFACE.DOUT1
DOUT2_FPGA: sheet U_ADC/DOUT2, port A_ADC_INTERFACE.DOUT2
DOUT3_FPGA: sheet U_ADC/DOUT3, port A_ADC_INTERFACE.DOUT3
ERROR_FPGA: sheet U_ADC/ERROR, port A_ADC_CONFIG.ERROR
FSYNC_FPGA: sheet U_ADC/FSYNC, port A_ADC_INTERFACE.FSYNC
IO0_FPGA: port A_IO0, sheet U_ADC/IO0
IO1_FPGA: port A_IO1, sheet U_ADC/IO1
IO4_FPGA: port A_IO4, sheet U_ADC/IO4
IO5_FPGA: port A_IO5, sheet U_ADC/IO5
IO6_FPGA: port A_IO6, sheet U_ADC/IO6
IO7_FPGA: port A_IO7, sheet U_ADC/IO7
MIC_FILTER_OUT_N: sheet U_signal_processing_assembly/MIC_OUT_0-, sheet U_ADC/MIC3_IN+
MIC_FILTER_OUT_N: sheet U_signal_processing_assembly/MIC_OUT_1-, sheet U_ADC/MIC2_IN+  [a separate net that carries the same name]
MIC_FILTER_OUT_N: sheet U_signal_processing_assembly/MIC_OUT_2-, sheet U_ADC/MIC1_IN+  [a separate net that carries the same name]
MIC_FILTER_OUT_N: sheet U_signal_processing_assembly/MIC_OUT_3-, sheet U_ADC/MIC0_IN+  [a separate net that carries the same name]
MIC_FILTER_OUT_P: sheet U_signal_processing_assembly/MIC_OUT_0+, sheet U_ADC/MIC3_IN-
MIC_FILTER_OUT_P: sheet U_signal_processing_assembly/MIC_OUT_1+, sheet U_ADC/MIC2_IN-  [a separate net that carries the same name]
MIC_FILTER_OUT_P: sheet U_signal_processing_assembly/MIC_OUT_2+, sheet U_ADC/MIC1_IN-  [a separate net that carries the same name]
MIC_FILTER_OUT_P: sheet U_signal_processing_assembly/MIC_OUT_3+, sheet U_ADC/MIC0_IN-  [a separate net that carries the same name]
RESET_FPGA: sheet U_ADC/RESET, port A_ADC_CONFIG.RESET
SCLK_FPGA: sheet U_ADC/SCLK, port A_ADC_CONFIG.SCLK
SCLK_VP: sheet U_signal_processing_assembly/SCLK, port A_PGA_INT.SCLK
SDI_FPGA: sheet U_ADC/SDI, port A_ADC_CONFIG.SDI
SDI_VP: sheet U_signal_processing_assembly/SDI, port A_PGA_INT.SDI
SDO_FPGA: sheet U_ADC/SDO, port A_ADC_CONFIG.SDO
START_FPGA: sheet U_ADC/START, port A_ADC_CONFIG.START
SYNC_VP: sheet U_signal_processing_assembly/SYNC, port A_PGA_INT.SYNC
NetD2_U_MIC_connection1_2: sheet U_signal_processing_assembly/SWITCH_3, sheet U_switch_isolation/IO_IN3
NetD2_U_MIC_connection2_2: sheet U_signal_processing_assembly/SWITCH_2, sheet U_switch_isolation/IO_IN2
NetD2_U_MIC_connection3_2: sheet U_signal_processing_assembly/SWITCH_1, sheet U_switch_isolation/IO_IN1
NetD2_U_MIC_connection4_2: sheet U_signal_processing_assembly/SWITCH_0, sheet U_switch_isolation/IO_IN0
NetJM1_45: sheet U_signal_processing_assembly/RESET_1, port A_PGA_INT.RESET_1
NetJM1_47: sheet U_signal_processing_assembly/RESET_0, port A_PGA_INT.RESET_0
NetJM1_51: sheet U_signal_processing_assembly/SDO, port A_PGA_INT.SDO
NetJM1_65: sheet U_switch_isolation/IO_OUT3, port A_MIC_SENSE.PORT_3
NetJM1_67: sheet U_switch_isolation/IO_OUT2, port A_MIC_SENSE.PORT_2
NetJM1_69: sheet U_switch_isolation/IO_OUT1, port A_MIC_SENSE.PORT_1
NetJM1_71: sheet U_switch_isolation/IO_OUT0, port A_MIC_SENSE.PORT_0
NetJM1_75: sheet U_signal_processing_assembly/DISABLE_1, port A_MIC_DISABLE.DIS_MIC_1
NetJM1_77: sheet U_signal_processing_assembly/DISABLE_0, port A_MIC_DISABLE.DIS_MIC_0
NetJM1_79: sheet U_signal_processing_assembly/DISABLE_3, port A_MIC_DISABLE.DIS_MIC_3
NetJM1_81: sheet U_signal_processing_assembly/DISABLE_2, port A_MIC_DISABLE.DIS_MIC_2
NetJM3_26: port A_PWR_EN, sheet U_analog_power/BUCK_EN

### Layout directives
mark named 3.3V logic: (no net found under the mark)
mark named 1.8V logic: (no net found under the mark)

### Notes on the sheet
- Analog system assembly
- Drawn by
- Approved by
- Document type
- Date of issue
- Legal owner
- Title
- Circuit diagram
- File
- AGH Marines
- Document no.
- Revision
- Status
- Sheet
- Size
- Lang.
- /
- A4
- EN

## Sheet signal_processing_assembly.SchDoc: Main Analog signal processing assembly
size A4; DocumentNumber: ADC-SCH-05; SheetNumber: 5; SheetTotal: 20
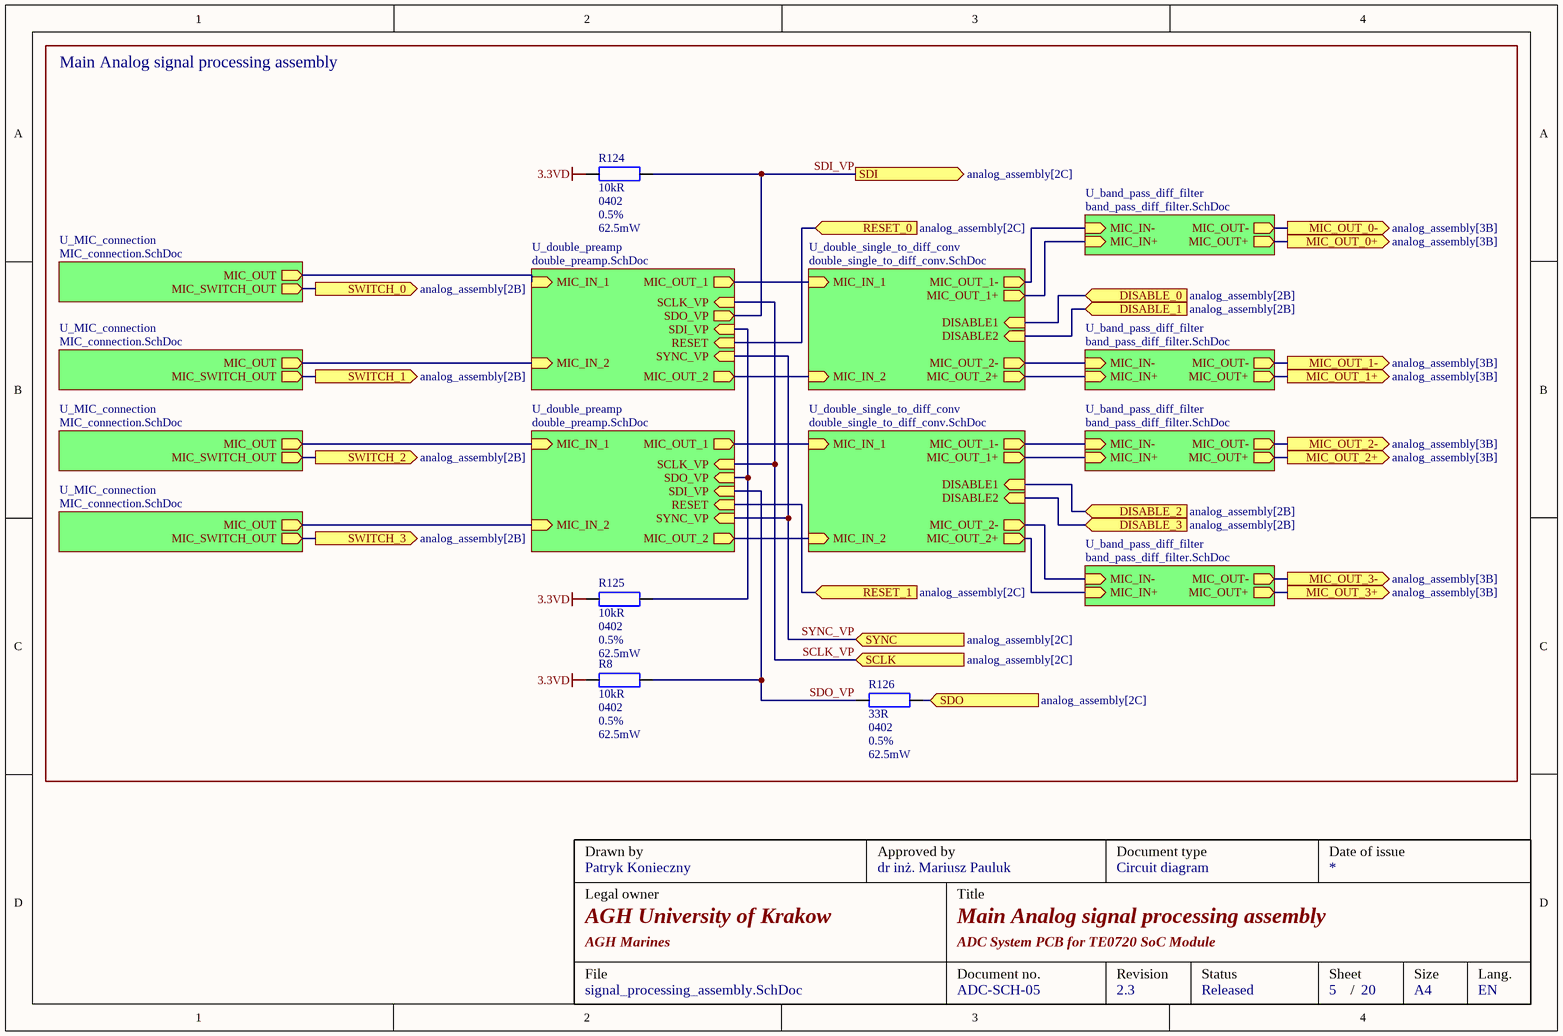
[diagram p8: signal_processing_assembly.SchDoc]

### Parts
R8  value 10kR  Package: 0402  Tolerance: 0.5%  Power: 62.5mW  [RESC_0402]  (hidden comment: AC0402DR-0710KL)
R124  value 10kR  Package: 0402  Tolerance: 0.5%  Power: 62.5mW  [RESC_0402]  (hidden comment: AC0402DR-0710KL)
R125  value 10kR  Package: 0402  Tolerance: 0.5%  Power: 62.5mW  [RESC_0402]  (hidden comment: AC0402DR-0710KL)
R126  value 33R  Package: 0402  Tolerance: 0.5%  Power: 62.5mW  [RESC_0402]  (hidden comment: RG1005R-330-D-T10)

### Blocks framed on the sheet
Main Analog signal processing assembly: R8 R124-R126

### Sub-sheets
U_band_pass_diff_filter = band_pass_diff_filter.SchDoc: MIC_IN+ (in), MIC_IN- (in), MIC_OUT+ (out), MIC_OUT- (out)
U_band_pass_diff_filter = band_pass_diff_filter.SchDoc: MIC_IN+ (in), MIC_IN- (in), MIC_OUT+ (out), MIC_OUT- (out)
U_band_pass_diff_filter = band_pass_diff_filter.SchDoc: MIC_IN+ (in), MIC_IN- (in), MIC_OUT+ (out), MIC_OUT- (out)
U_band_pass_diff_filter = band_pass_diff_filter.SchDoc: MIC_IN+ (in), MIC_IN- (in), MIC_OUT+ (out), MIC_OUT- (out)
U_double_preamp = double_preamp.SchDoc: MIC_IN_1 (in), MIC_OUT_1 (out), SDO_VP (out), SDI_VP (in), SYNC_VP (in), SCLK_VP (in), RESET (in), MIC_OUT_2 (out), MIC_IN_2 (in)
U_double_preamp = double_preamp.SchDoc: MIC_IN_1 (in), MIC_OUT_1 (out), SDO_VP (in), SDI_VP (in), SYNC_VP (in), SCLK_VP (in), RESET (in), MIC_OUT_2 (out), MIC_IN_2 (in)
U_double_single_to_diff_conv = double_single_to_diff_conv.SchDoc: DISABLE1 (in), DISABLE2 (in), MIC_OUT_1- (out), MIC_OUT_1+ (out), MIC_OUT_2- (out), MIC_OUT_2+ (out), MIC_IN_1 (in), MIC_IN_2 (in)
U_double_single_to_diff_conv = double_single_to_diff_conv.SchDoc: DISABLE1 (in), DISABLE2 (in), MIC_OUT_1- (out), MIC_OUT_1+ (out), MIC_OUT_2- (out), MIC_OUT_2+ (out), MIC_IN_1 (in), MIC_IN_2 (in)
U_MIC_connection = MIC_connection.SchDoc: MIC_OUT (out), MIC_SWITCH_OUT (out)
U_MIC_connection = MIC_connection.SchDoc: MIC_OUT (out), MIC_SWITCH_OUT (out)
U_MIC_connection = MIC_connection.SchDoc: MIC_OUT (out), MIC_SWITCH_OUT (out)
U_MIC_connection = MIC_connection.SchDoc: MIC_OUT (out), MIC_SWITCH_OUT (out)

### Ports
DISABLE_0 (in, see analog_assembly[2B]), DISABLE_1 (in, see analog_assembly[2B]), DISABLE_2 (in, see analog_assembly[2B]), DISABLE_3 (in, see analog_assembly[2B]), MIC_OUT_0+ (out, see analog_assembly[3B]), MIC_OUT_0- (out, see analog_assembly[3B]), MIC_OUT_1+ (out, see analog_assembly[3B]), MIC_OUT_1- (out, see analog_assembly[3B]), MIC_OUT_2+ (out, see analog_assembly[3B]), MIC_OUT_2- (out, see analog_assembly[3B]), MIC_OUT_3+ (out, see analog_assembly[3B]), MIC_OUT_3- (out, see analog_assembly[3B]), RESET_0 (in, see analog_assembly[2C]), RESET_1 (in, see analog_assembly[2C]), SCLK (in, see analog_assembly[2C]), SDI (out, see analog_assembly[2C]), SDO (in, see analog_assembly[2C]), SWITCH_0 (out, see analog_assembly[2B]), SWITCH_1 (out, see analog_assembly[2B]), SWITCH_2 (out, see analog_assembly[2B]), SWITCH_3 (out, see analog_assembly[2B]), SYNC (in, see analog_assembly[2C])

### Nets
3.3VD: R8.2 R124.2 R125.2
MIC1_DIFF_N: sheet U_double_single_to_diff_conv/MIC_OUT_1-, sheet U_band_pass_diff_filter/MIC_IN-
MIC1_DIFF_N: sheet U_double_single_to_diff_conv/MIC_OUT_1-, sheet U_band_pass_diff_filter/MIC_IN-  [a separate net that carries the same name]
MIC1_DIFF_P: sheet U_double_single_to_diff_conv/MIC_OUT_1+, sheet U_band_pass_diff_filter/MIC_IN+
MIC1_DIFF_P: sheet U_double_single_to_diff_conv/MIC_OUT_1+, sheet U_band_pass_diff_filter/MIC_IN+  [a separate net that carries the same name]
MIC2_DIFF_N: sheet U_double_single_to_diff_conv/MIC_OUT_2-, sheet U_band_pass_diff_filter/MIC_IN-
MIC2_DIFF_N: sheet U_double_single_to_diff_conv/MIC_OUT_2-, sheet U_band_pass_diff_filter/MIC_IN-  [a separate net that carries the same name]
MIC2_DIFF_P: sheet U_double_single_to_diff_conv/MIC_OUT_2+, sheet U_band_pass_diff_filter/MIC_IN+
MIC2_DIFF_P: sheet U_double_single_to_diff_conv/MIC_OUT_2+, sheet U_band_pass_diff_filter/MIC_IN+  [a separate net that carries the same name]
MIC_FILTER_OUT_N: port MIC_OUT_0-, sheet U_band_pass_diff_filter/MIC_OUT-
MIC_FILTER_OUT_N: port MIC_OUT_1-, sheet U_band_pass_diff_filter/MIC_OUT-  [a separate net that carries the same name]
MIC_FILTER_OUT_N: port MIC_OUT_2-, sheet U_band_pass_diff_filter/MIC_OUT-  [a separate net that carries the same name]
MIC_FILTER_OUT_N: port MIC_OUT_3-, sheet U_band_pass_diff_filter/MIC_OUT-  [a separate net that carries the same name]
MIC_FILTER_OUT_P: port MIC_OUT_0+, sheet U_band_pass_diff_filter/MIC_OUT+
MIC_FILTER_OUT_P: port MIC_OUT_1+, sheet U_band_pass_diff_filter/MIC_OUT+  [a separate net that carries the same name]
MIC_FILTER_OUT_P: port MIC_OUT_2+, sheet U_band_pass_diff_filter/MIC_OUT+  [a separate net that carries the same name]
MIC_FILTER_OUT_P: port MIC_OUT_3+, sheet U_band_pass_diff_filter/MIC_OUT+  [a separate net that carries the same name]
SCLK_VP: port SCLK, sheet U_double_preamp/SCLK_VP, sheet U_double_preamp/SCLK_VP
SDI_VP: R124.1 ; port SDI, sheet U_double_preamp/SDO_VP
SDO_VP: R8.1 R126.1 ; sheet U_double_preamp/SDI_VP
SYNC_VP: port SYNC, sheet U_double_preamp/SYNC_VP, sheet U_double_preamp/SYNC_VP
NetC5_U_double_preamp1_1: sheet U_double_preamp/MIC_OUT_1, sheet U_double_single_to_diff_conv/MIC_IN_1
NetC5_U_double_preamp2_1: sheet U_double_preamp/MIC_OUT_1, sheet U_double_single_to_diff_conv/MIC_IN_1
NetC6_U_double_preamp1_2: sheet U_MIC_connection/MIC_OUT, sheet U_double_preamp/MIC_IN_1
NetC6_U_double_preamp2_2: sheet U_MIC_connection/MIC_OUT, sheet U_double_preamp/MIC_IN_1
NetC14_U_double_preamp1_1: sheet U_double_preamp/MIC_OUT_2, sheet U_double_single_to_diff_conv/MIC_IN_2
NetC14_U_double_preamp2_1: sheet U_double_preamp/MIC_OUT_2, sheet U_double_single_to_diff_conv/MIC_IN_2
NetC15_U_double_preamp1_2: sheet U_MIC_connection/MIC_OUT, sheet U_double_preamp/MIC_IN_2
NetC15_U_double_preamp2_2: sheet U_MIC_connection/MIC_OUT, sheet U_double_preamp/MIC_IN_2
NetD2_U_MIC_connection1_2: port SWITCH_3, sheet U_MIC_connection/MIC_SWITCH_OUT
NetD2_U_MIC_connection2_2: port SWITCH_2, sheet U_MIC_connection/MIC_SWITCH_OUT
NetD2_U_MIC_connection3_2: port SWITCH_1, sheet U_MIC_connection/MIC_SWITCH_OUT
NetD2_U_MIC_connection4_2: port SWITCH_0, sheet U_MIC_connection/MIC_SWITCH_OUT
NetJM1_45: port RESET_1, sheet U_double_preamp/RESET
NetJM1_47: port RESET_0, sheet U_double_preamp/RESET
NetJM1_51: R126.2 ; port SDO
NetJM1_75: port DISABLE_1, sheet U_double_single_to_diff_conv/DISABLE2
NetJM1_77: port DISABLE_0, sheet U_double_single_to_diff_conv/DISABLE1
NetJM1_79: port DISABLE_3, sheet U_double_single_to_diff_conv/DISABLE2
NetJM1_81: port DISABLE_2, sheet U_double_single_to_diff_conv/DISABLE1
NetR80_U_double_preamp1_1: R125.1 ; sheet U_double_preamp/SDI_VP, sheet U_double_preamp/SDO_VP

### Notes on the sheet
- Drawn by
- Approved by
- Document type
- Date of issue
- Legal owner
- Title
- Circuit diagram
- File
- AGH Marines
- Document no.
- Revision
- Status
- Sheet
- Size
- Lang.
- /
- A4
- EN

### Library data of the parts
R8 R124 R125 = AC0402DR-0710KL: as R96 on sheet power_management; Supplier 1: Mouser; Supplier Part Number 1: 603-AC0402DR-0710KL
R126 = RG1005R-330-D-T10: as R110 on sheet JTAG; Supplier 1: Mouser; Supplier Part Number 1: 754-RG1005R-330DT10

## Sheet MIC_connection.SchDoc: Hydrophone input: 3.5 mm TRS jack with plug-in power bias
size A4; DocumentNumber: ADC-SCH-09; SheetNumber: 9; SheetTotal: 20
Used 4 times, as channels U_analog_assembly/U_signal_processing_assembly/U_MIC_connection, U_analog_assembly/U_signal_processing_assembly/U_MIC_connection, U_analog_assembly/U_signal_processing_assembly/U_MIC_connection, U_analog_assembly/U_signal_processing_assembly/U_MIC_connection. Parts and nets are listed once, with the designators drawn on the sheet.
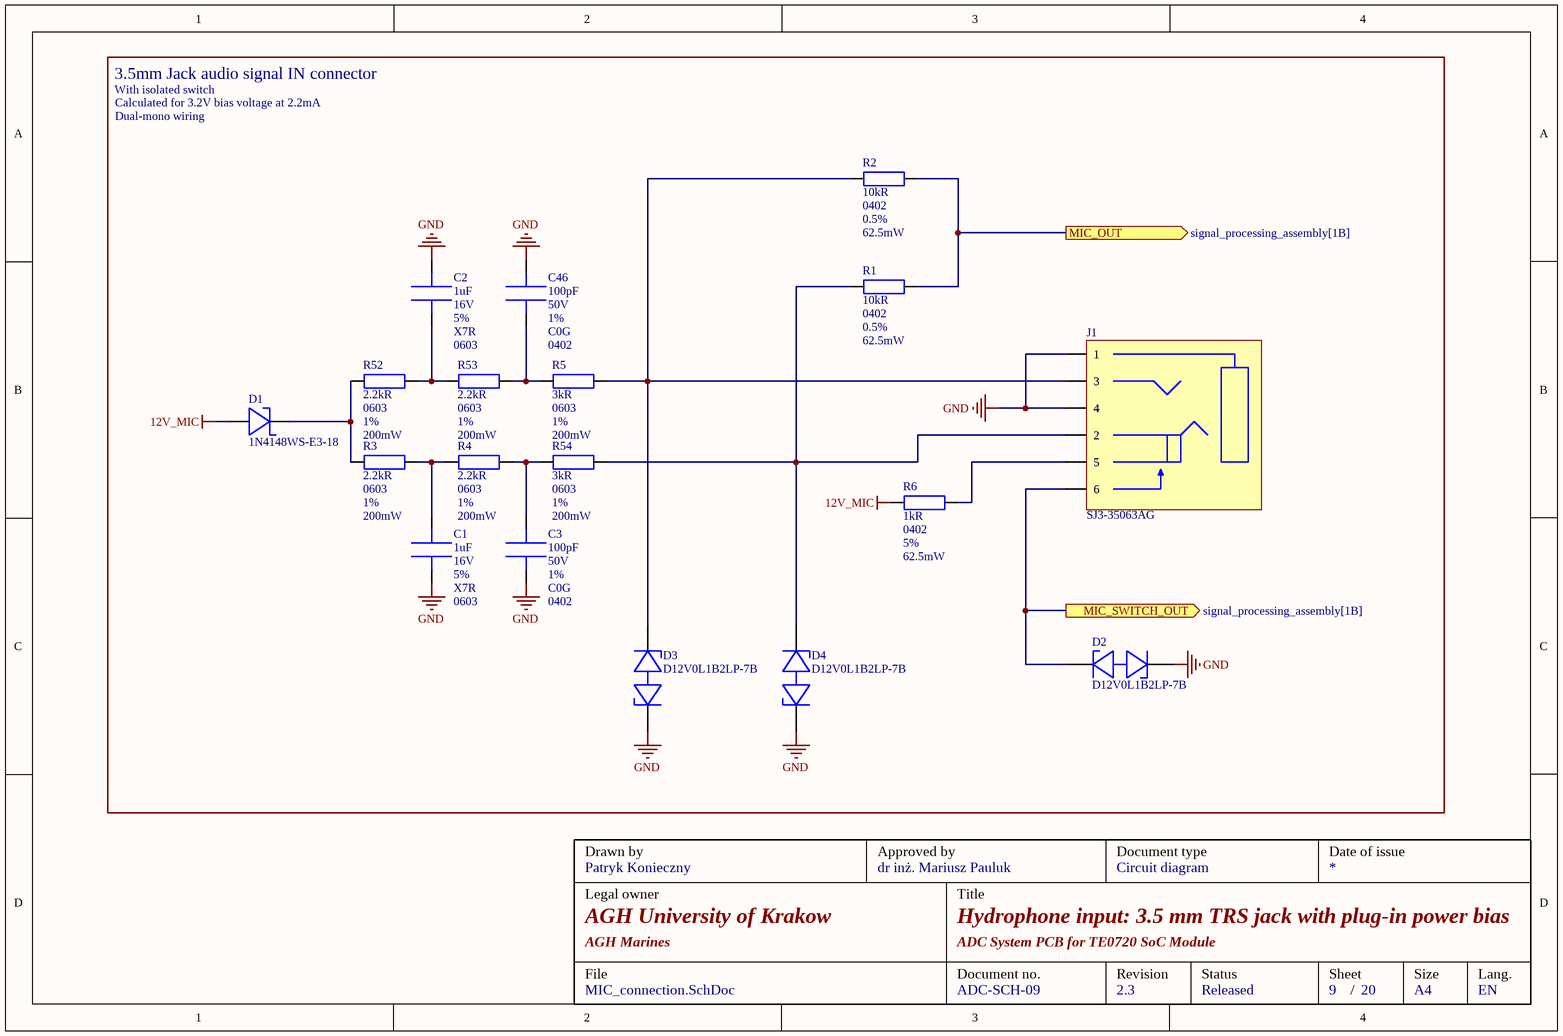
[diagram p9: MIC_connection.SchDoc]

### Parts
C1  value 1uF  Voltage: 16V  Tolerance: 5%  Dielectric: X7R  Package: 0603  [CAPC_0603]  (hidden comment: CC0603JRX7R7BB105)
C2  value 1uF  Voltage: 16V  Tolerance: 5%  Dielectric: X7R  Package: 0603  [CAPC_0603]  (hidden comment: CC0603JRX7R7BB105)
C3  value 100pF  Voltage: 50V  Tolerance: 1%  Dielectric: C0G  Package: 0402  [CAPC_0402]  (hidden comment: KGM05ACG1H101FH)
C46  value 100pF  Voltage: 50V  Tolerance: 1%  Dielectric: C0G  Package: 0402  [CAPC_0402]  (hidden comment: KGM05ACG1H101FH)
D1  1N4148WS-E3-18  [DIOC_SOD323_P]
D2  D12V0L1B2LP-7B  [DIOC_DFN-1006-2]
D3  D12V0L1B2LP-7B  [DIOC_DFN-1006-2]
D4  D12V0L1B2LP-7B  [DIOC_DFN-1006-2]
J1  SJ3-35063AG  [CONT_SJ3-35063AG]
R1  value 10kR  Package: 0402  Tolerance: 0.5%  Power: 62.5mW  [RESC_0402]  (hidden comment: AC0402DR-0710KL)
R2  value 10kR  Package: 0402  Tolerance: 0.5%  Power: 62.5mW  [RESC_0402]  (hidden comment: AC0402DR-0710KL)
R3  value 2.2kR  Package: 0603  Tolerance: 1%  Power: 200mW  [RESC_0603]  (hidden comment: AC0603FR-7W2K2L)
R4  value 2.2kR  Package: 0603  Tolerance: 1%  Power: 200mW  [RESC_0603]  (hidden comment: AC0603FR-7W2K2L)
R5  value 3kR  Package: 0603  Tolerance: 1%  Power: 200mW  [RESC_0603]  (hidden comment: RC0603FR-7W3KL)
R6  value 1kR  Package: 0402  Tolerance: 5%  Power: 62.5mW  [RESC_0402]  (hidden comment: RC0402JR-7D1KL)
R52  value 2.2kR  Package: 0603  Tolerance: 1%  Power: 200mW  [RESC_0603]  (hidden comment: AC0603FR-7W2K2L)
R53  value 2.2kR  Package: 0603  Tolerance: 1%  Power: 200mW  [RESC_0603]  (hidden comment: AC0603FR-7W2K2L)
R54  value 3kR  Package: 0603  Tolerance: 1%  Power: 200mW  [RESC_0603]  (hidden comment: RC0603FR-7W3KL)

### Ports
MIC_OUT (out, see signal_processing_assembly[1B]), MIC_SWITCH_OUT (out, see signal_processing_assembly[1B])

### Nets
12V_MIC: D1.1 R6.2
GND: C1.1 C2.1 C3.2 C46.2 D2.1 D3.1 D4.1 J1.1 J1.4
MIC_OUT: R1.2 R2.2 ; port MIC_OUT
MIC_SWITCH_OUT: D2.2 J1.6 ; port MIC_SWITCH_OUT
NetC1_2: C1.2 R3.1 R4.2
NetC2_2: C2.2 R52.2 R53.1
NetC3_1: C3.1 R4.1 R54.2
NetC46_1: C46.1 R5.2 R53.2
NetD1_2: D1.2 R3.2 R52.1
NetD3_2: D3.2 J1.3 R2.1 R5.1
NetD4_2: D4.2 J1.2 R1.1 R54.1
NetJ1_5: J1.5 R6.1

### Channels
U_analog_assembly/U_signal_processing_assembly/U_MIC_connection: designators end in _U_MIC_connection4; ports MIC_OUT=NetC6_U_double_preamp2_2 MIC_SWITCH_OUT=NetD2_U_MIC_connection4_2
U_analog_assembly/U_signal_processing_assembly/U_MIC_connection: designators end in _U_MIC_connection3; ports MIC_OUT=NetC15_U_double_preamp2_2 MIC_SWITCH_OUT=NetD2_U_MIC_connection3_2
U_analog_assembly/U_signal_processing_assembly/U_MIC_connection: designators end in _U_MIC_connection2; ports MIC_OUT=NetC6_U_double_preamp1_2 MIC_SWITCH_OUT=NetD2_U_MIC_connection2_2
U_analog_assembly/U_signal_processing_assembly/U_MIC_connection: designators end in _U_MIC_connection1; ports MIC_OUT=NetC15_U_double_preamp1_2 MIC_SWITCH_OUT=NetD2_U_MIC_connection1_2

### Notes on the sheet
- 3.5mm Jack audio signal IN connector
- With isolated switch
- Calculated for 3.2V bias voltage at 2.2mA
- Dual-mono wiring
- Drawn by
- Approved by
- Document type
- Date of issue
- Legal owner
- Title
- Circuit diagram
- File
- AGH Marines
- Document no.
- Revision
- Status
- Sheet
- Size
- Lang.
- /
- A4
- EN

### Library data of the parts
C1 C2 = CC0603JRX7R7BB105: Multilayer Ceramic Capacitors MLCC - SMD/SMT 16V 1uF X7R 0603 5% HI CV; Manufacturer: YAGEO; Supplier 1: Mouser; Supplier Part Number 1: 603-CC0603JRX77BB105
C3 C46 = KGM05ACG1H101FH: Multilayer Ceramic Capacitors MLCC - SMD/SMT 50V 100pF C0G 0402 1 %; Manufacturer: KYOCERA AVX; Supplier 1: Mouser; Supplier Part Number 1: 581-04025A101F
D1 = 1N4148WS-E3-18: Small Signal Switching Diodes 100 Volt 350mA 4ns; Manufacturer: Vishay; Package: SOD-323-2; Supplier 1: Mouser; Supplier Part Number 1: 78-1N4148WS-E3-18
D2-D4 = D12V0L1B2LP-7B: ESD Protection Diodes / TVS Diodes Data Line Protection TVS Bi 13V 4A 10pF; Manufacturer: Diodes Incorporated; Voltage: 12V; Package: DFN1006-2; Capacitance: 10pF; Supplier 1: Mouser; Supplier Part Number 1: 621-D12V0L1B2LP-7B
J1 = SJ3-35063AG: Phone Connectors Audio Jack, 3.5mm, Through Hole, 3 Conductors, 1 Switches; Manufacturer: Same Sky; Supplier 1: Mouser; Supplier Part Number 1: 179-SJ3-35063AG
R1 R2 = AC0402DR-0710KL: as R96 on sheet power_management; Supplier 1: Mouser; Supplier Part Number 1: 603-AC0402DR-0710KL
R3 R4 R52 R53 = AC0603FR-7W2K2L: Thick Film Resistors 2.2 kOhms 1/5 W 75 V 1% 0603 100 PPM / C - 55 C / + 155 C AEC-Q200; Manufacturer: YAGEO; Supplier 1: Mouser; Supplier Part Number 1: 603-AC0603FR-7W2K2L
R5 R54 = RC0603FR-7W3KL: Thick Film Resistors 2.2 kOhms 1/5 W 75 V 1% 0603 100 PPM / C - 55 C / + 155 C AEC-Q200; Manufacturer: YAGEO; Supplier 1: Mouser; Supplier Part Number 1: 603-RC0603FR-7W3KL
R6 = RC0402JR-7D1KL: as R108 on sheet JTAG; Supplier 1: Mouser; Supplier Part Number 1: 603-RC0402JR-7D1KL